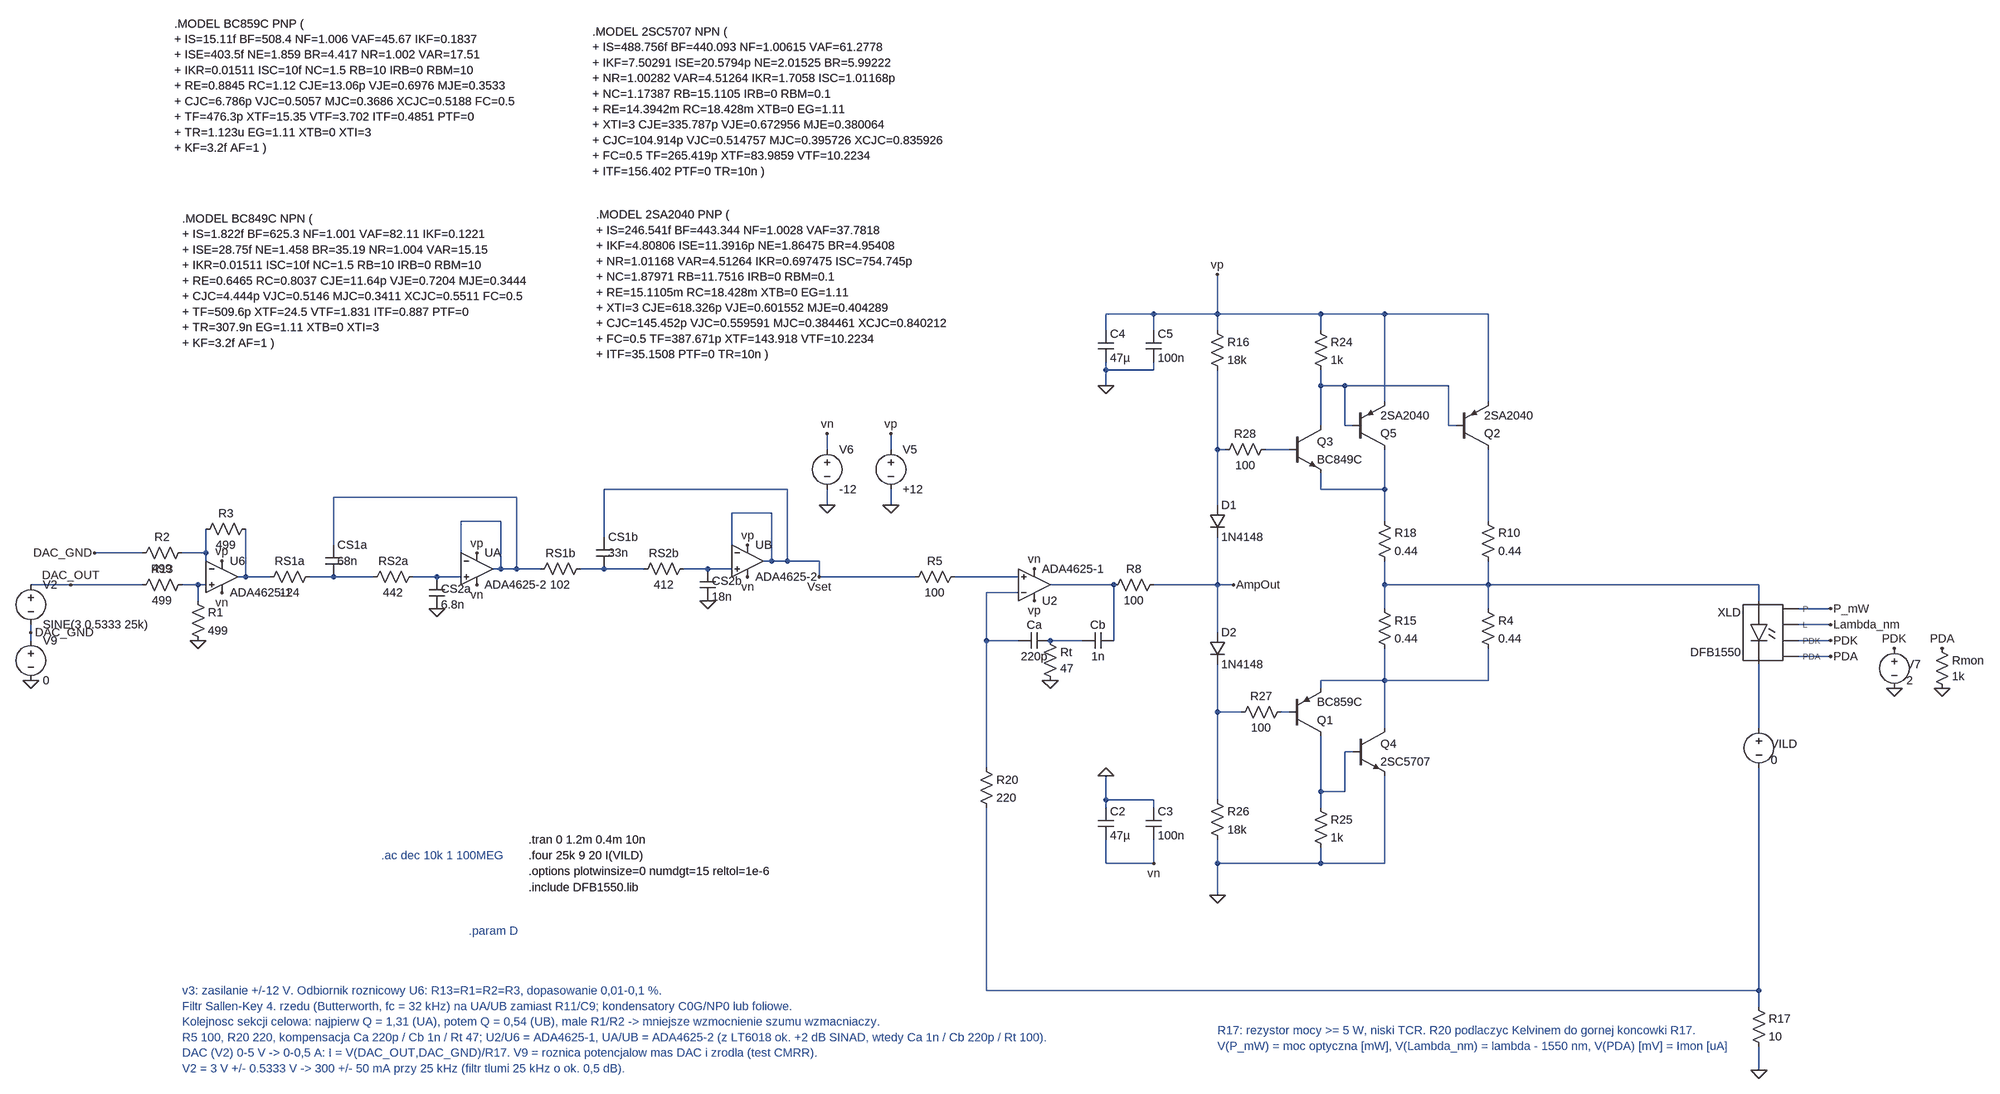
[diagram p0: schematic Laser_v3.asc]
Laser_v3.asc, the LTspice schematic file:
Version 4.1
SHEET 1 3148 1552
WIRE 1392 -400 1296 -400
WIRE 1520 -400 1520 -480
WIRE 1520 -400 1392 -400
WIRE 1728 -400 1520 -400
WIRE 1856 -400 1728 -400
WIRE 2064 -400 1856 -400
WIRE 1296 -368 1296 -400
WIRE 1392 -368 1392 -400
WIRE 1520 -368 1520 -400
WIRE 1728 -368 1728 -400
WIRE 1296 -288 1296 -304
WIRE 1392 -288 1392 -304
WIRE 1392 -288 1296 -288
WIRE 1296 -256 1296 -288
WIRE 1728 -256 1728 -288
WIRE 1776 -256 1728 -256
WIRE 1984 -256 1776 -256
WIRE 1856 -224 1856 -400
WIRE 2064 -224 2064 -400
WIRE 1728 -176 1728 -256
WIRE 1776 -176 1776 -256
WIRE 1792 -176 1776 -176
WIRE 1984 -176 1984 -256
WIRE 2000 -176 1984 -176
WIRE 736 -128 736 -160
WIRE 864 -128 864 -160
WIRE 1520 -128 1520 -288
WIRE 1536 -128 1520 -128
WIRE 1664 -128 1616 -128
WIRE 1728 -48 1728 -80
WIRE 1856 -48 1856 -128
WIRE 1856 -48 1728 -48
WIRE 736 -16 736 -48
WIRE 864 -16 864 -48
WIRE 1520 -16 1520 -128
WIRE 1856 16 1856 -48
WIRE 2064 16 2064 -128
WIRE 1056 128 992 128
WIRE 1120 128 1056 128
WIRE 1312 144 1184 144
WIRE 1520 144 1520 48
WIRE 1520 144 1392 144
WIRE 1552 144 1520 144
WIRE 1856 144 1856 96
WIRE 2064 144 2064 96
WIRE 2064 144 1856 144
WIRE 2608 144 2064 144
WIRE 1120 160 1056 160
WIRE 2608 176 2608 144
WIRE 1856 192 1856 144
WIRE 2064 192 2064 144
WIRE 1520 240 1520 144
WIRE 1056 256 1056 160
WIRE 1120 256 1056 256
WIRE 1312 256 1312 144
WIRE 1856 336 1856 272
WIRE 1856 336 1728 336
WIRE 2064 336 2064 272
WIRE 2064 336 1856 336
WIRE 1728 352 1728 336
WIRE 1520 400 1520 304
WIRE 1568 400 1520 400
WIRE 1664 400 1648 400
WIRE 1856 432 1856 336
WIRE 2608 432 2608 304
WIRE 1792 480 1776 480
WIRE 1056 512 1056 256
WIRE 1728 560 1728 448
WIRE 1776 560 1776 480
WIRE 1776 560 1728 560
WIRE 1296 576 1296 528
WIRE 1392 576 1296 576
WIRE 1520 576 1520 400
WIRE 1296 592 1296 576
WIRE 1392 592 1392 576
WIRE 1728 592 1728 560
WIRE 1296 704 1296 656
WIRE 1392 704 1392 656
WIRE 1392 704 1296 704
WIRE 1520 704 1520 656
WIRE 1728 704 1728 672
WIRE 1728 704 1520 704
WIRE 1856 704 1856 528
WIRE 1856 704 1728 704
WIRE 1520 768 1520 704
WIRE 1056 960 1056 592
WIRE 2608 960 2608 512
WIRE 2608 960 1056 960
WIRE 2608 992 2608 960
WIRE 2608 1120 2608 1072
WIRE 1248 256 1184 256
WIRE 2752 192 2688 192
WIRE 2752 224 2688 224
WIRE 2752 256 2688 256
WIRE 2752 288 2688 288
WIRE -864 224 -864 240
WIRE -864 240 -864 256
WIRE -864 144 -784 144
WIRE -784 144 -640 144
WIRE -560 144 -528 144
WIRE -528 144 -512 144
WIRE -528 144 -528 176
WIRE -560 80 -512 80
WIRE -512 32 -512 80
WIRE -512 80 -512 112
WIRE -432 32 -432 128
WIRE -448 128 -432 128
WIRE -640 80 -736 80
WIRE -432 128 -384 128
WIRE -304 128 -256 128
WIRE -256 128 -176 128
WIRE -96 128 -48 128
WIRE -48 128 0 128
WIRE 0 96 0 16
WIRE 0 16 80 16
WIRE 80 16 80 112
WIRE 64 112 80 112
WIRE -256 64 -256 -32
WIRE -256 -32 112 -32
WIRE 112 -32 112 112
WIRE 80 112 112 112
WIRE 112 112 160 112
WIRE 240 112 288 112
WIRE 288 112 368 112
WIRE 448 112 496 112
WIRE 496 112 544 112
WIRE 544 80 544 0
WIRE 544 0 624 0
WIRE 624 0 624 96
WIRE 608 96 624 96
WIRE 288 48 288 -48
WIRE 288 -48 656 -48
WIRE 656 -48 656 96
WIRE 624 96 656 96
WIRE 656 96 720 96
WIRE 720 96 720 128
WIRE 720 128 912 128
FLAG 864 -160 vp
FLAG 1296 528 0
FLAG 1296 -256 0
FLAG 2608 1120 0
FLAG 736 -160 vn
FLAG 864 -16 0
FLAG 736 -16 0
FLAG 1152 112 vn
FLAG 1152 176 vp
FLAG 1520 -480 vp
FLAG 1552 144 AmpOut
FLAG 1520 768 0
FLAG 1392 704 vn
FLAG 1184 336 0
FLAG 2752 192 P_mW
FLAG 2752 224 Lambda_nm
FLAG 2752 256 PDK
FLAG 2752 288 PDA
FLAG 2880 272 PDK
FLAG 2880 352 0
FLAG 2976 272 PDA
FLAG 2976 352 0
FLAG -864 240 DAC_GND
FLAG -784 144 DAC_OUT
FLAG -864 336 0
FLAG -736 80 DAC_GND
FLAG -528 256 0
FLAG -480 96 vp
FLAG -480 160 vn
FLAG -48 192 0
FLAG 32 80 vp
FLAG 32 144 vn
FLAG 496 176 0
FLAG 576 64 vp
FLAG 576 128 vn
FLAG 720 128 Vset
SYMBOL voltage 864 -144 R0
WINDOW 123 0 0 Left 0
WINDOW 39 0 0 Left 0
SYMATTR InstName V5
SYMATTR Value +12
SYMBOL voltage 736 -144 R0
WINDOW 123 0 0 Left 0
WINDOW 39 0 0 Left 0
SYMATTR InstName V6
SYMATTR Value -12
SYMBOL cap 1184 240 R90
WINDOW 0 0 32 VBottom 2
WINDOW 3 32 32 VTop 2
SYMATTR InstName Ca
SYMATTR Value 220p
SYMBOL res 1840 176 R0
SYMATTR InstName R15
SYMATTR Value 0.44
SYMBOL cap 1280 592 R0
SYMATTR InstName C2
SYMATTR Value 47µ
SYMBOL cap 1376 592 R0
SYMATTR InstName C3
SYMATTR Value 100n
SYMBOL cap 1280 -368 R0
SYMATTR InstName C4
SYMATTR Value 47µ
SYMBOL cap 1376 -368 R0
SYMATTR InstName C5
SYMATTR Value 100n
SYMBOL res 1504 -384 R0
SYMATTR InstName R16
SYMATTR Value 18k
SYMBOL res 2592 976 R0
SYMATTR InstName R17
SYMATTR Value 10
SYMBOL res 1840 0 R0
SYMATTR InstName R18
SYMATTR Value 0.44
SYMBOL diode 1504 -16 R0
SYMATTR InstName D1
SYMATTR Value 1N4148
SYMBOL res 1040 496 R0
SYMATTR InstName R20
SYMATTR Value 220
SYMBOL diode 1504 240 R0
SYMATTR InstName D2
SYMATTR Value 1N4148
SYMBOL npn 1664 -176 R0
SYMATTR InstName Q3
SYMATTR Value BC849C
SYMBOL res 1712 -384 R0
SYMATTR InstName R24
SYMATTR Value 1k
SYMBOL res 1712 576 R0
SYMATTR InstName R25
SYMATTR Value 1k
SYMBOL res 1504 560 R0
SYMATTR InstName R26
SYMATTR Value 18k
SYMBOL res 1664 384 R90
WINDOW 0 0 56 VBottom 2
WINDOW 3 32 56 VTop 2
SYMATTR InstName R27
SYMATTR Value 100
SYMBOL res 1632 -144 R90
WINDOW 0 0 56 VBottom 2
WINDOW 3 32 56 VTop 2
SYMATTR InstName R28
SYMATTR Value 100
SYMBOL pnp 1664 448 M180
SYMATTR InstName Q1
SYMATTR Value BC859C
SYMBOL pnp 2000 -128 M180
SYMATTR InstName Q2
SYMATTR Value 2SA2040
SYMBOL res 2048 0 R0
SYMATTR InstName R10
SYMATTR Value 0.44
SYMBOL npn 1792 432 R0
SYMATTR InstName Q4
SYMATTR Value 2SC5707
SYMBOL OpAmps\\ADA4625-1 1152 208 M180
SYMATTR InstName U2
SYMBOL res 2048 176 R0
SYMATTR InstName R4
SYMATTR Value 0.44
SYMBOL res 1008 112 R90
WINDOW 0 0 56 VBottom 2
WINDOW 3 32 56 VTop 2
SYMATTR InstName R5
SYMATTR Value 100
SYMBOL res 1408 128 R90
WINDOW 0 0 56 VBottom 2
WINDOW 3 32 56 VTop 2
SYMATTR InstName R8
SYMATTR Value 100
SYMBOL pnp 1792 -128 M180
SYMATTR InstName Q5
SYMATTR Value 2SA2040
SYMBOL cap 1312 240 R90
WINDOW 0 0 32 VBottom 2
WINDOW 3 32 32 VTop 2
SYMATTR InstName Cb
SYMATTR Value 1n
SYMBOL res 1168 240 R0
WINDOW 0 36 40 Left 2
WINDOW 3 36 72 Left 2
SYMATTR InstName Rt
SYMATTR Value 47
SYMBOL DFB1550 2608 176 R0
SYMATTR InstName XLD
SYMATTR Value DFB1550
SYMBOL voltage 2608 416 R0
WINDOW 0 24 48 Left 2
WINDOW 3 24 80 Left 2
SYMATTR InstName VILD
SYMATTR Value 0
SYMBOL voltage 2880 256 R0
WINDOW 0 24 48 Left 2
WINDOW 3 24 80 Left 2
SYMATTR InstName V7
SYMATTR Value 2
SYMBOL res 2960 256 R0
WINDOW 0 36 40 Left 2
WINDOW 3 36 72 Left 2
SYMATTR InstName Rmon
SYMATTR Value 1k
SYMBOL voltage -864 128 R0
SYMATTR InstName V2
SYMATTR Value SINE(3 0.5333 25k)
SYMATTR Value2 AC 1
SYMBOL voltage -864 240 R0
SYMATTR InstName V9
SYMATTR Value 0
SYMBOL OpAmps\\ADA4625-1 -480 64 R0
SYMATTR InstName U6
SYMBOL res -544 128 R90
WINDOW 0 0 56 VBottom 2
WINDOW 3 32 56 VTop 2
SYMATTR InstName R13
SYMATTR Value 499
SYMBOL res -544 160 R0
SYMATTR InstName R1
SYMATTR Value 499
SYMBOL res -544 64 R90
WINDOW 0 0 56 VBottom 2
WINDOW 3 32 56 VTop 2
SYMATTR InstName R2
SYMATTR Value 499
SYMBOL res -416 16 R90
WINDOW 0 0 56 VBottom 2
WINDOW 3 32 56 VTop 2
SYMATTR InstName R3
SYMATTR Value 499
SYMBOL res -288 112 R90
WINDOW 0 0 56 VBottom 2
WINDOW 3 32 56 VTop 2
SYMATTR InstName RS1a
SYMATTR Value 124
SYMBOL cap -272 64 R0
WINDOW 0 24 0 Left 2
WINDOW 3 24 32 Left 2
SYMATTR InstName CS1a
SYMATTR Value 68n
SYMBOL res -80 112 R90
WINDOW 0 0 56 VBottom 2
WINDOW 3 32 56 VTop 2
SYMATTR InstName RS2a
SYMATTR Value 442
SYMBOL cap -64 128 R0
WINDOW 0 24 24 Left 2
WINDOW 3 24 56 Left 2
SYMATTR InstName CS2a
SYMATTR Value 6.8n
SYMBOL OpAmps\\ADA4625-2 32 48 R0
SYMATTR InstName UA
SYMBOL res 256 96 R90
WINDOW 0 0 56 VBottom 2
WINDOW 3 32 56 VTop 2
SYMATTR InstName RS1b
SYMATTR Value 102
SYMBOL cap 272 48 R0
WINDOW 0 24 0 Left 2
WINDOW 3 24 32 Left 2
SYMATTR InstName CS1b
SYMATTR Value 33n
SYMBOL res 464 96 R90
WINDOW 0 0 56 VBottom 2
WINDOW 3 32 56 VTop 2
SYMATTR InstName RS2b
SYMATTR Value 412
SYMBOL cap 480 112 R0
WINDOW 0 24 24 Left 2
WINDOW 3 24 56 Left 2
SYMATTR InstName CS2b
SYMATTR Value 18n
SYMBOL OpAmps\\ADA4625-2 576 32 R0
SYMATTR InstName UB
TEXT 16 840 Left 2 ;.param D
TEXT -160 688 Left 2 ;.ac dec 10k 1 100MEG
TEXT 272 -600 Left 2 !.MODEL 2SA2040 PNP (\n+ IS=246.541f BF=443.344 NF=1.0028 VAF=37.7818\n+ IKF=4.80806 ISE=11.3916p NE=1.86475 BR=4.95408\n+ NR=1.01168 VAR=4.51264 IKR=0.697475 ISC=754.745p\n+ NC=1.87971 RB=11.7516 IRB=0 RBM=0.1\n+ RE=15.1105m RC=18.428m XTB=0 EG=1.11\n+ XTI=3 CJE=618.326p VJE=0.601552 MJE=0.404289\n+ CJC=145.452p VJC=0.559591 MJC=0.384461 XCJC=0.840212\n+ FC=0.5 TF=387.671p XTF=143.918 VTF=10.2234\n+ ITF=35.1508 PTF=0 TR=10n )
TEXT 264 -968 Left 2 !.MODEL 2SC5707 NPN (\n+ IS=488.756f BF=440.093 NF=1.00615 VAF=61.2778\n+ IKF=7.50291 ISE=20.5794p NE=2.01525 BR=5.99222\n+ NR=1.00282 VAR=4.51264 IKR=1.7058 ISC=1.01168p\n+ NC=1.17387 RB=15.1105 IRB=0 RBM=0.1\n+ RE=14.3942m RC=18.428m XTB=0 EG=1.11\n+ XTI=3 CJE=335.787p VJE=0.672956 MJE=0.380064\n+ CJC=104.914p VJC=0.514757 MJC=0.395726 XCJC=0.835926\n+ FC=0.5 TF=265.419p XTF=83.9859 VTF=10.2234\n+ ITF=156.402 PTF=0 TR=10n )
TEXT -576 -984 Left 2 !.MODEL BC859C PNP (\n+ IS=15.11f BF=508.4 NF=1.006 VAF=45.67 IKF=0.1837\n+ ISE=403.5f NE=1.859 BR=4.417 NR=1.002 VAR=17.51\n+ IKR=0.01511 ISC=10f NC=1.5 RB=10 IRB=0 RBM=10\n+ RE=0.8845 RC=1.12 CJE=13.06p VJE=0.6976 MJE=0.3533\n+ CJC=6.786p VJC=0.5057 MJC=0.3686 XCJC=0.5188 FC=0.5\n+ TF=476.3p XTF=15.35 VTF=3.702 ITF=0.4851 PTF=0\n+ TR=1.123u EG=1.11 XTB=0 XTI=3\n+ KF=3.2f AF=1 )
TEXT -560 -592 Left 2 !.MODEL BC849C NPN (\n+ IS=1.822f BF=625.3 NF=1.001 VAF=82.11 IKF=0.1221\n+ ISE=28.75f NE=1.458 BR=35.19 NR=1.004 VAR=15.15\n+ IKR=0.01511 ISC=10f NC=1.5 RB=10 IRB=0 RBM=10\n+ RE=0.6465 RC=0.8037 CJE=11.64p VJE=0.7204 MJE=0.3444\n+ CJC=4.444p VJC=0.5146 MJC=0.3411 XCJC=0.5511 FC=0.5\n+ TF=509.6p XTF=24.5 VTF=1.831 ITF=0.887 PTF=0\n+ TR=307.9n EG=1.11 XTB=0 XTI=3\n+ KF=3.2f AF=1 )
TEXT 136 656 Left 2 !.tran 0 1.2m 0.4m 10n
TEXT 136 688 Left 2 !.four 25k 9 20 I(VILD)
TEXT 136 720 Left 2 !.options plotwinsize=0 numdgt=15 reltol=1e-6
TEXT 136 752 Left 2 !.include DFB1550.lib
TEXT 1520 1040 Left 2 ;R17: rezystor mocy >= 5 W, niski TCR. R20 podlaczyc Kelvinem do gornej koncowki R17.\nV(P_mW) = moc optyczna [mW], V(Lambda_nm) = lambda - 1550 nm, V(PDA) [mV] = Imon [uA]
TEXT -560 960 Left 2 ;v3: zasilanie +/-12 V. Odbiornik roznicowy U6: R13=R1=R2=R3, dopasowanie 0,01-0,1 %.\nFiltr Sallen-Key 4. rzedu (Butterworth, fc = 32 kHz) na UA/UB zamiast R11/C9; kondensatory C0G/NP0 lub foliowe.\nKolejnosc sekcji celowa: najpierw Q = 1,31 (UA), potem Q = 0,54 (UB), male R1/R2 -> mniejsze wzmocnienie szumu wzmacniaczy.\nR5 100, R20 220, kompensacja Ca 220p / Cb 1n / Rt 47; U2/U6 = ADA4625-1, UA/UB = ADA4625-2 (z LT6018 ok. +2 dB SINAD, wtedy Ca 1n / Cb 220p / Rt 100).\nDAC (V2) 0-5 V -> 0-0,5 A: I = V(DAC_OUT,DAC_GND)/R17. V9 = roznica potencjalow mas DAC i zrodla (test CMRR).\nV2 = 3 V +/- 0.5333 V -> 300 +/- 50 mA przy 25 kHz (filtr tlumi 25 kHz o ok. 0,5 dB).

The netlist it stands for:
* Laser_v3.asc
V5 vp 0 +12
V6 vn 0 -12
Ca N016 N009 220p
R15 N008 N010 0.44
C2 0 vn 47µ
C3 0 vn 100n
C4 vp 0 47µ
C5 vp 0 100n
R16 vp N002 18k
R17 N015 0 10
R18 N004 N008 0.44
D1 N002 AmpOut 1N4148
R20 N009 N015 220
D2 AmpOut N011 1N4148
Q3 N001 N003 N004 0 BC849C
R24 vp N001 1k
R25 N014 0 1k
R26 N011 0 18k
R27 N012 N011 100
R28 N003 N002 100
Q1 N014 N012 N010 0 BC859C
Q2 N005 N001 vp 0 2SA2040
R10 N005 N008 0.44
Q4 N010 N014 0 0 2SC5707
X§U2 N006 N009 vp vn N007 ADA4625-1  ; pins In+ In- V+ V- OUT
R4 N008 N010 0.44
R5 N006 Vset 100
R8 AmpOut N007 100
Q5 N004 N001 vp 0 2SA2040
Cb N007 N016 1n
Rt N016 0 47
X§XLD N008 N013 P_mW Lambda_nm PDK PDA DFB1550  ; pins A K P L PDK PDA
VILD N013 N015 0
V7 PDK 0 2
Rmon PDA 0 1k
V2 DAC_OUT DAC_GND SINE(3 0.5333 25k) AC 1
V9 DAC_GND 0 0
X§U6 N017 N018 vp vn N019 ADA4625-1  ; pins In+ In- V+ V- OUT
R13 N017 DAC_OUT 499
R1 N017 0 499
R2 N018 DAC_GND 499
R3 N019 N018 499
RS1a N020 N019 124
CS1a N022 N020 68n
RS2a N021 N020 442
CS2a N021 0 6.8n
X§UA N021 N022 vp vn N022 ADA4625-2  ; pins In+ In- V+ V- OUT
RS1b N023 N022 102
CS1b Vset N023 33n
RS2b N024 N023 412
CS2b N024 0 18n
X§UB N024 Vset vp vn Vset ADA4625-2  ; pins In+ In- V+ V- OUT
.model D D
.lib standard.dio
.model NPN NPN
.model PNP PNP
.lib standard.bjt
* .param D
* .ac dec 10k 1 100MEG
.MODEL 2SA2040 PNP (
+ IS=246.541f BF=443.344 NF=1.0028 VAF=37.7818
+ IKF=4.80806 ISE=11.3916p NE=1.86475 BR=4.95408
+ NR=1.01168 VAR=4.51264 IKR=0.697475 ISC=754.745p
+ NC=1.87971 RB=11.7516 IRB=0 RBM=0.1
+ RE=15.1105m RC=18.428m XTB=0 EG=1.11
+ XTI=3 CJE=618.326p VJE=0.601552 MJE=0.404289
+ CJC=145.452p VJC=0.559591 MJC=0.384461 XCJC=0.840212
+ FC=0.5 TF=387.671p XTF=143.918 VTF=10.2234
+ ITF=35.1508 PTF=0 TR=10n )
.MODEL 2SC5707 NPN (
+ IS=488.756f BF=440.093 NF=1.00615 VAF=61.2778
+ IKF=7.50291 ISE=20.5794p NE=2.01525 BR=5.99222
+ NR=1.00282 VAR=4.51264 IKR=1.7058 ISC=1.01168p
+ NC=1.17387 RB=15.1105 IRB=0 RBM=0.1
+ RE=14.3942m RC=18.428m XTB=0 EG=1.11
+ XTI=3 CJE=335.787p VJE=0.672956 MJE=0.380064
+ CJC=104.914p VJC=0.514757 MJC=0.395726 XCJC=0.835926
+ FC=0.5 TF=265.419p XTF=83.9859 VTF=10.2234
+ ITF=156.402 PTF=0 TR=10n )
.MODEL BC859C PNP (
+ IS=15.11f BF=508.4 NF=1.006 VAF=45.67 IKF=0.1837
+ ISE=403.5f NE=1.859 BR=4.417 NR=1.002 VAR=17.51
+ IKR=0.01511 ISC=10f NC=1.5 RB=10 IRB=0 RBM=10
+ RE=0.8845 RC=1.12 CJE=13.06p VJE=0.6976 MJE=0.3533
+ CJC=6.786p VJC=0.5057 MJC=0.3686 XCJC=0.5188 FC=0.5
+ TF=476.3p XTF=15.35 VTF=3.702 ITF=0.4851 PTF=0
+ TR=1.123u EG=1.11 XTB=0 XTI=3
+ KF=3.2f AF=1 )
.MODEL BC849C NPN (
+ IS=1.822f BF=625.3 NF=1.001 VAF=82.11 IKF=0.1221
+ ISE=28.75f NE=1.458 BR=35.19 NR=1.004 VAR=15.15
+ IKR=0.01511 ISC=10f NC=1.5 RB=10 IRB=0 RBM=10
+ RE=0.6465 RC=0.8037 CJE=11.64p VJE=0.7204 MJE=0.3444
+ CJC=4.444p VJC=0.5146 MJC=0.3411 XCJC=0.5511 FC=0.5
+ TF=509.6p XTF=24.5 VTF=1.831 ITF=0.887 PTF=0
+ TR=307.9n EG=1.11 XTB=0 XTI=3
+ KF=3.2f AF=1 )
.tran 0 1.2m 0.4m 10n
.four 25k 9 20 I(VILD)
.options plotwinsize=0 numdgt=15 reltol=1e-6
.include DFB1550.lib
* R17: rezystor mocy >= 5 W, niski TCR. R20 podlaczyc Kelvinem do gornej koncowki R17.
* V(P_mW) = moc optyczna [mW], V(Lambda_nm) = lambda - 1550 nm, V(PDA) [mV] = Imon [uA]
* v3: zasilanie +/-12 V. Odbiornik roznicowy U6: R13=R1=R2=R3, dopasowanie 0,01-0,1 %.
* Filtr Sallen-Key 4. rzedu (Butterworth, fc = 32 kHz) na UA/UB zamiast R11/C9; kondensatory C0G/NP0 lub foliowe.
* Kolejnosc sekcji celowa: najpierw Q = 1,31 (UA), potem Q = 0,54 (UB), male R1/R2 -> mniejsze wzmocnienie szumu wzmacniaczy.
* R5 100, R20 220, kompensacja Ca 220p / Cb 1n / Rt 47; U2/U6 = ADA4625-1, UA/UB = ADA4625-2 (z LT6018 ok. +2 dB SINAD, wtedy Ca 1n / Cb 220p / Rt 100).
* DAC (V2) 0-5 V -> 0-0,5 A: I = V(DAC_OUT,DAC_GND)/R17. V9 = roznica potencjalow mas DAC i zrodla (test CMRR).
* V2 = 3 V +/- 0.5333 V -> 300 +/- 50 mA przy 25 kHz (filtr tlumi 25 kHz o ok. 0,5 dB).
.backanno
.end